# Altium schematic sheet 01-TOP QCMI SOM.SchDoc: Title and Rev History
size 558 x 431 mm; Designer: B. Jordan; DsnPath: G:\My Drive\Quilter Computer - Engineering Assets\NXP i.MX8M-Mini\8MMINILPD4-CPU2-DESIGNFILES\8MMINILPD4-CPU2-DESIGNFILES\SCH-47712_A4.DSN; Author: B. Jordan; DrawnBy: B. Jordan; Revision: 0; SheetNumber: 01; SheetTotal: 10; CHK_APP_DATE: --/--/--; DSN_APP_DATE: --/--/--; ENG_APP_DATE: --/--/--
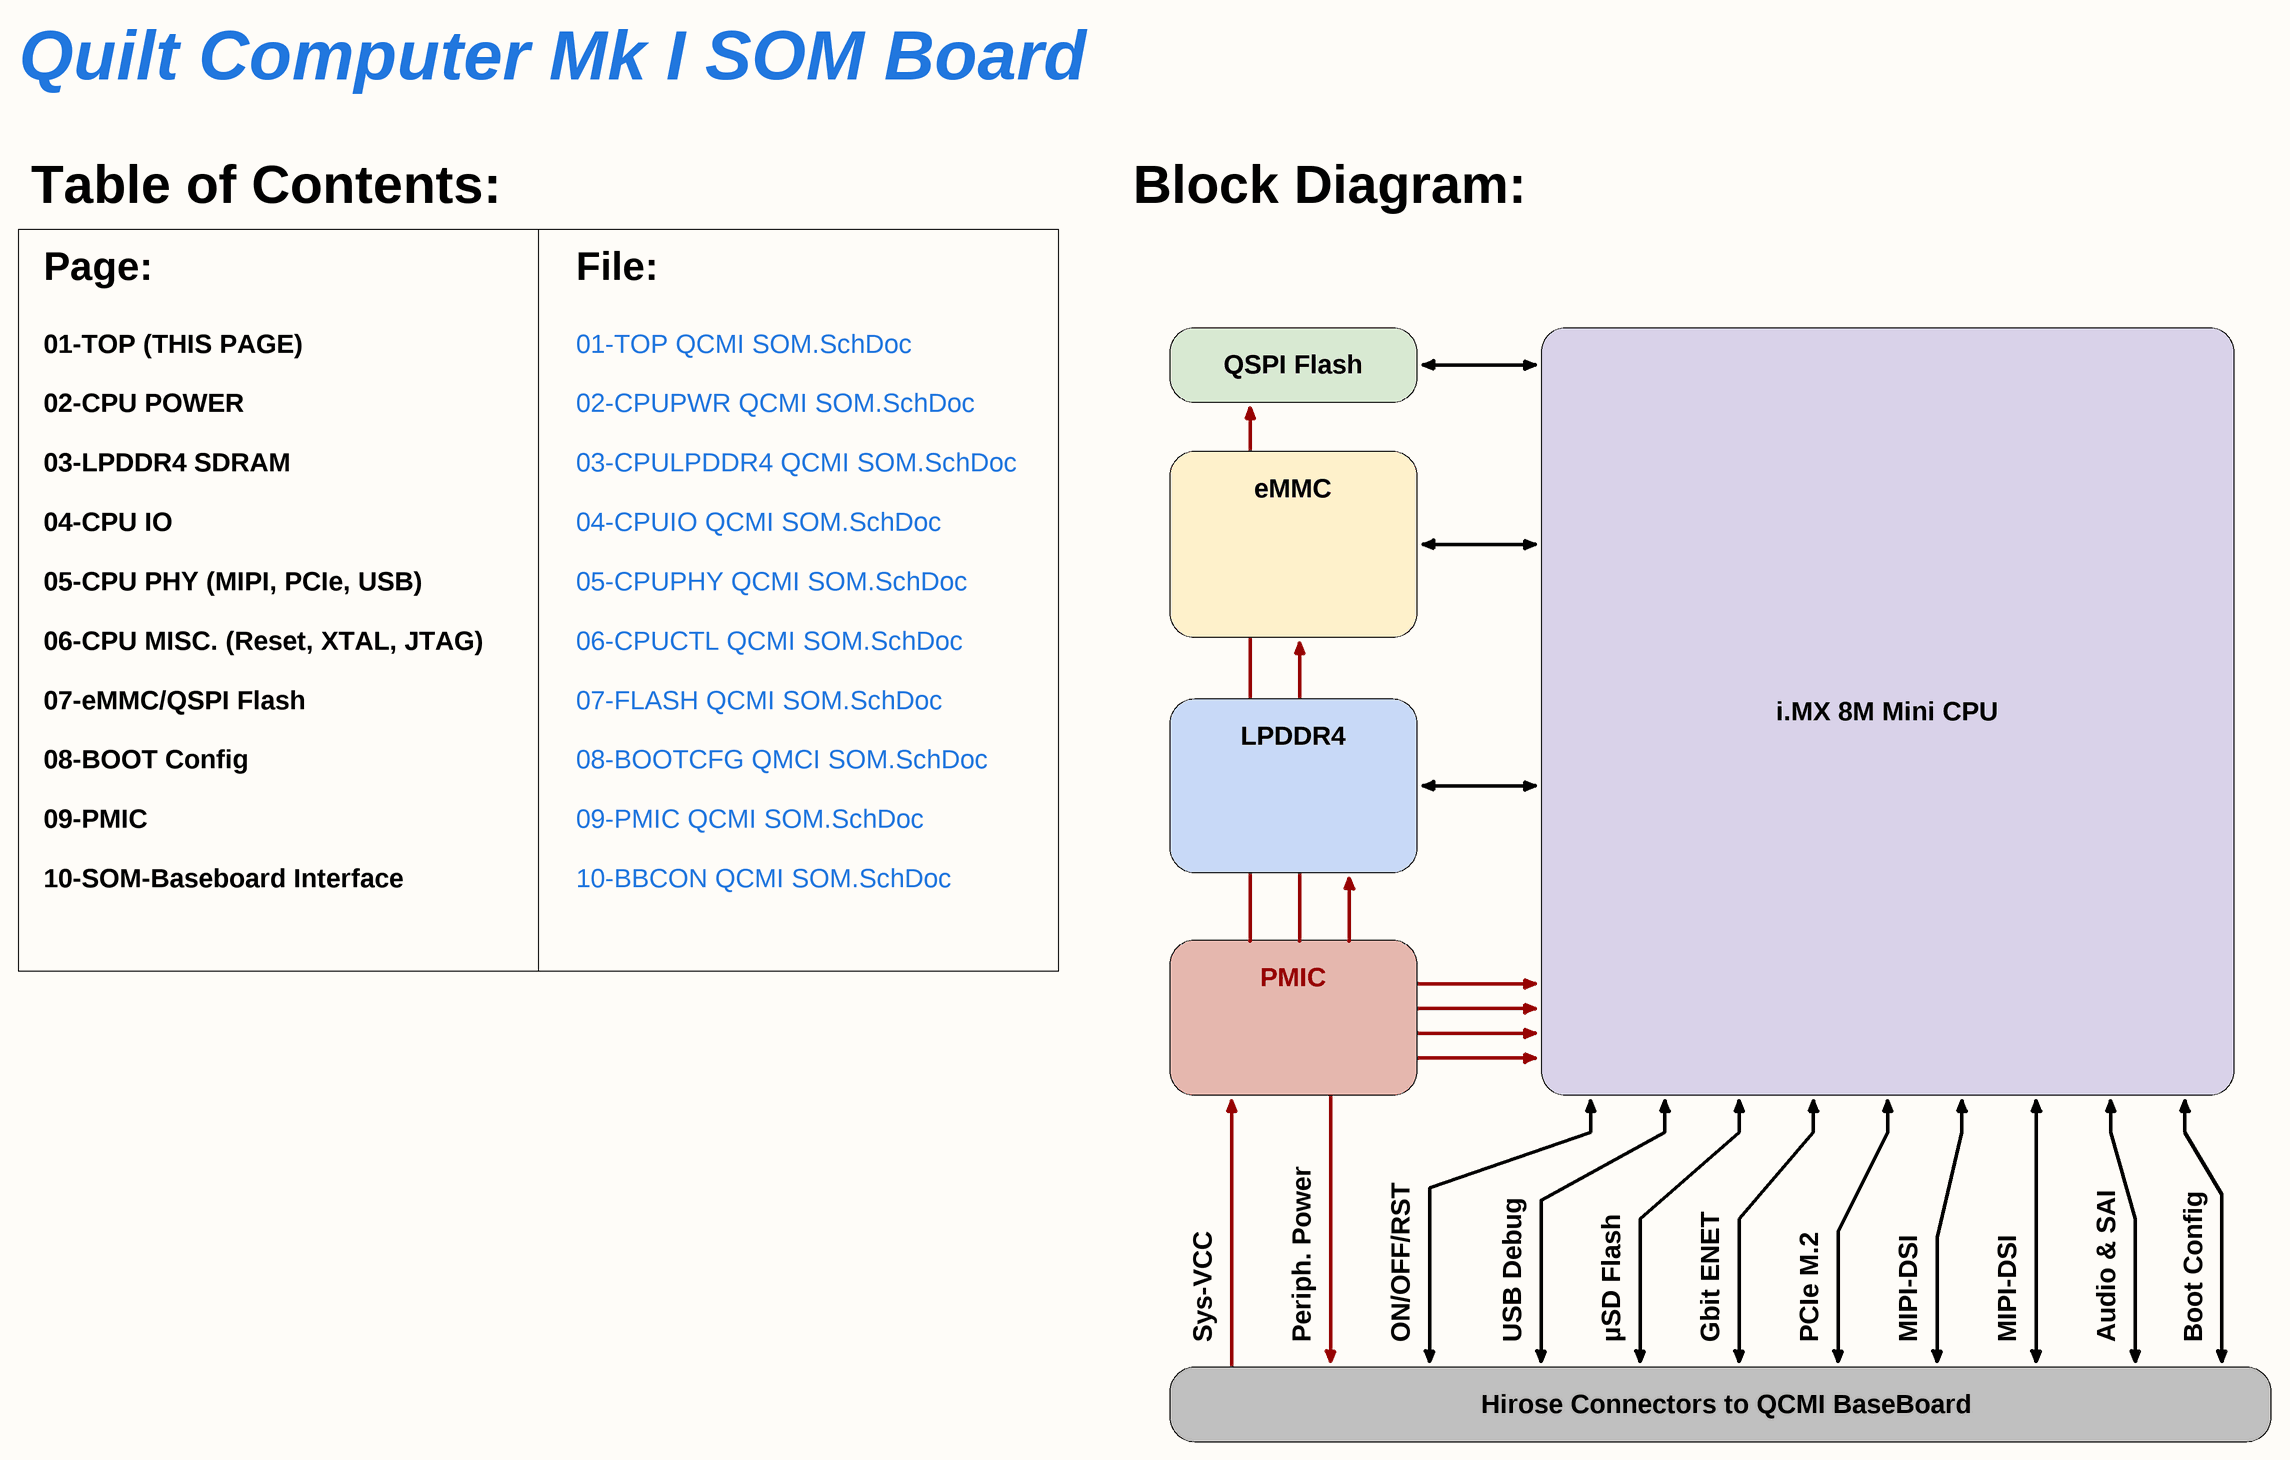
[diagram p0: 01-TOP QCMI SOM.SchDoc]

## Notes on the sheet
- Quilt Computer Mk I SOM Board
- Table of Contents:
- Block Diagram:
- Page:
- File:
- QSPI Flash
- eMMC
- LPDDR4
- i.MX 8M Mini CPU
- 01-TOP (THIS PAGE)
  02-CPU POWER
  03-LPDDR4 SDRAM
  04-CPU IO
  05-CPU PHY (MIPI, PCIe, USB)
  06-CPU MISC. (Reset, XTAL, JTAG)
  07-eMMC/QSPI Flash
  08-BOOT Config
  09-PMIC
  10-SOM-Baseboard Interface
- 01-TOP QCMI SOM.SchDoc
  02-CPUPWR QCMI SOM.SchDoc
  03-CPULPDDR4 QCMI SOM.SchDoc
  04-CPUIO QCMI SOM.SchDoc
  05-CPUPHY QCMI SOM.SchDoc
  06-CPUCTL QCMI SOM.SchDoc
  07-FLASH QCMI SOM.SchDoc
  08-BOOTCFG QMCI SOM.SchDoc
  09-PMIC QCMI SOM.SchDoc
  10-BBCON QCMI SOM.SchDoc
- PMIC
- Sys-VCC
- Periph. Power
- ON/OFF/RST
- USB Debug
- µSD Flash
- Gbit ENET
- PCIe M.2
- MIPI-DSI
- Audio & SAI
- Boot Config
- Hirose Connectors to QCMI BaseBoard
- DWG. NO.
- REV.
- SHT.
- REVISION
- DESCRIPTION
- DATE
- APPROVED
- ENG:
- DSN:
- APPROVALS
- PROJECT
- REFERENCE DOCUMENTS
- BOM:
- CHK:
- TITLE
- ASSY DWG:
- FAB DWG:
- PCB DWG:
- SIZE
- FILE NAME
- C
- SCHEMATIC DOCUMENT NUMBER
- SHEET
- OF
- REV